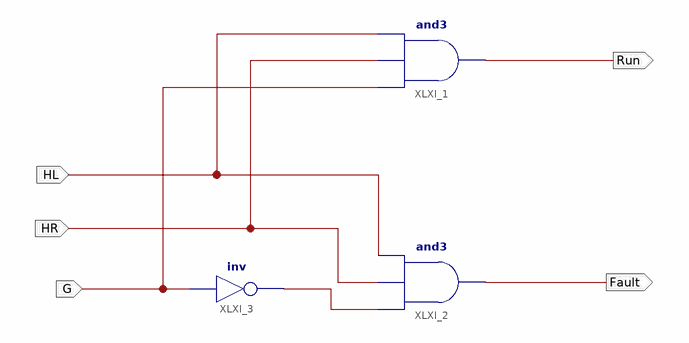
[diagram p0: schematic sheet 1]
// Xilinx ISE schematic Interlock.sch (spartan6) as structural Verilog: 3 symbols, 5 ports
module Interlock (
  input  G,
  input  HR,
  input  HL,
  output Run,
  output Fault
);

  wire XLXN_1;

  and XLXI_1 (Run, G, HR, HL);
  and XLXI_2 (Fault, XLXN_1, HR, HL);
  not XLXI_3 (XLXN_1, G);
endmodule
